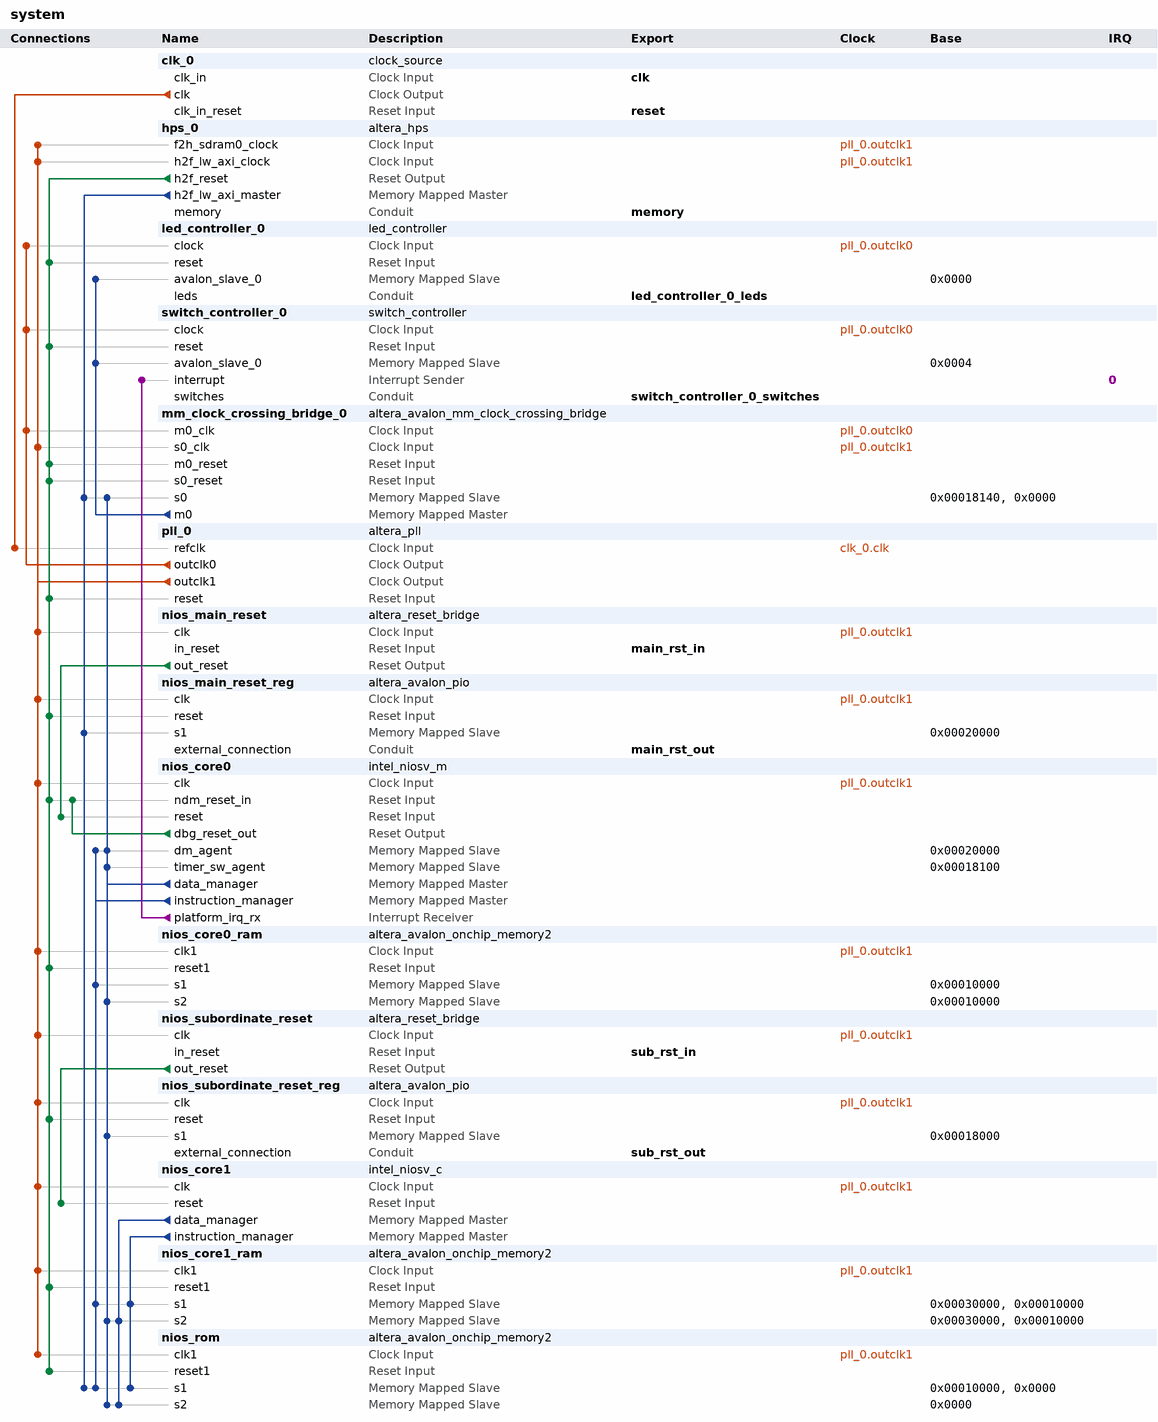
[diagram p0: system contents]
# Platform Designer (Qsys) system system, Cyclone V 5CSXFC6D6F31C6
# Parameters at their usual value, and those the tool derives, are not listed.
package require -exact qsys 25.1
create_system system
set_project_property DEVICE_FAMILY {Cyclone V}
set_project_property DEVICE 5CSXFC6D6F31C6

add_instance clk_0 clock_source 25.1
set_instance_parameter_value clk_0 clockFrequency 50000000
set_instance_parameter_value clk_0 resetSynchronousEdges DEASSERT

add_instance hps_0 altera_hps 25.1
set_instance_parameter_value hps_0 EMAC1_Mode N/A
set_instance_parameter_value hps_0 EMAC1_PinMuxing Unused
set_instance_parameter_value hps_0 F2SCLK_COLDRST_Enable false
set_instance_parameter_value hps_0 F2SCLK_DBGRST_Enable false
set_instance_parameter_value hps_0 F2SCLK_WARMRST_Enable false
set_instance_parameter_value hps_0 F2SDRAM_Type AXI-3
set_instance_parameter_value hps_0 F2SDRAM_Width 32
set_instance_parameter_value hps_0 F2SINTERRUPT_Enable false
set_instance_parameter_value hps_0 F2S_Width 0
set_instance_parameter_value hps_0 FPGA_PERIPHERAL_OUTPUT_CLOCK_FREQ_EMAC0_GTX_CLK 125
set_instance_parameter_value hps_0 FPGA_PERIPHERAL_OUTPUT_CLOCK_FREQ_EMAC0_MD_CLK 2.5
set_instance_parameter_value hps_0 FPGA_PERIPHERAL_OUTPUT_CLOCK_FREQ_EMAC1_GTX_CLK 125
set_instance_parameter_value hps_0 FPGA_PERIPHERAL_OUTPUT_CLOCK_FREQ_EMAC1_MD_CLK 2.5
set_instance_parameter_value hps_0 HPS_PROTOCOL DDR3
set_instance_parameter_value hps_0 I2C0_Mode N/A
set_instance_parameter_value hps_0 I2C0_PinMuxing Unused
set_instance_parameter_value hps_0 I2C1_Mode N/A
set_instance_parameter_value hps_0 I2C1_PinMuxing Unused
set_instance_parameter_value hps_0 LWH2F_Enable true
set_instance_parameter_value hps_0 MEM_BANKADDR_WIDTH 3
set_instance_parameter_value hps_0 MEM_CLK_FREQ 300.0
set_instance_parameter_value hps_0 MEM_CLK_FREQ_MAX 400.0
set_instance_parameter_value hps_0 MEM_COL_ADDR_WIDTH 8
set_instance_parameter_value hps_0 MEM_DQ_WIDTH 32
set_instance_parameter_value hps_0 MEM_DRV_STR RZQ/6
set_instance_parameter_value hps_0 MEM_ROW_ADDR_WIDTH 12
set_instance_parameter_value hps_0 MEM_RTT_NOM {ODT Disabled}
set_instance_parameter_value hps_0 MEM_RTT_WR {Dynamic ODT off}
set_instance_parameter_value hps_0 MEM_TCL 7
set_instance_parameter_value hps_0 MEM_TFAW_NS 37.5
set_instance_parameter_value hps_0 MEM_TINIT_US 499
set_instance_parameter_value hps_0 MEM_TMRD_CK 3
set_instance_parameter_value hps_0 MEM_TRAS_NS 40.0
set_instance_parameter_value hps_0 MEM_TRCD_NS 15.0
set_instance_parameter_value hps_0 MEM_TREFI_US 7.0
set_instance_parameter_value hps_0 MEM_TRFC_NS 75.0
set_instance_parameter_value hps_0 MEM_TRP_NS 15.0
set_instance_parameter_value hps_0 MEM_TWTR 2
set_instance_parameter_value hps_0 MEM_VENDOR JEDEC
set_instance_parameter_value hps_0 MEM_WTCL 6
set_instance_parameter_value hps_0 MPU_EVENTS_Enable true
set_instance_parameter_value hps_0 QSPI_Mode N/A
set_instance_parameter_value hps_0 QSPI_PinMuxing Unused
set_instance_parameter_value hps_0 REF_CLK_FREQ 125.0
set_instance_parameter_value hps_0 S2FCLK_USER2CLK 2
set_instance_parameter_value hps_0 S2F_Width 0
set_instance_parameter_value hps_0 SDIO_Mode N/A
set_instance_parameter_value hps_0 SDIO_PinMuxing Unused
set_instance_parameter_value hps_0 SPIM1_Mode N/A
set_instance_parameter_value hps_0 SPIM1_PinMuxing Unused
set_instance_parameter_value hps_0 STM_Enable false
set_instance_parameter_value hps_0 TIMING_BOARD_AC_SKEW 0.02
set_instance_parameter_value hps_0 TIMING_BOARD_AC_TO_CK_SKEW 0.0
set_instance_parameter_value hps_0 TIMING_BOARD_DQ_TO_DQS_SKEW 0.0
set_instance_parameter_value hps_0 TIMING_BOARD_MAX_CK_DELAY 0.6
set_instance_parameter_value hps_0 TIMING_BOARD_MAX_DQS_DELAY 0.6
set_instance_parameter_value hps_0 TIMING_BOARD_SKEW_BETWEEN_DQS 0.02
set_instance_parameter_value hps_0 TIMING_BOARD_SKEW_CKDQS_DIMM_MAX 0.01
set_instance_parameter_value hps_0 TIMING_BOARD_SKEW_CKDQS_DIMM_MIN -0.01
set_instance_parameter_value hps_0 TIMING_BOARD_SKEW_WITHIN_DQS 0.02
set_instance_parameter_value hps_0 TIMING_TDH 125
set_instance_parameter_value hps_0 TIMING_TDQSCK 400
set_instance_parameter_value hps_0 TIMING_TDQSQ 120
set_instance_parameter_value hps_0 TIMING_TDS 50
set_instance_parameter_value hps_0 TIMING_TIH 250
set_instance_parameter_value hps_0 TIMING_TIS 175
set_instance_parameter_value hps_0 TIMING_TQSH 0.38
set_instance_parameter_value hps_0 UART0_Mode N/A
set_instance_parameter_value hps_0 UART0_PinMuxing Unused
set_instance_parameter_value hps_0 USB1_Mode N/A
set_instance_parameter_value hps_0 USB1_PinMuxing Unused
set_instance_parameter_value hps_0 desired_cfg_clk_mhz 100.0
set_instance_parameter_value hps_0 desired_qspi_clk_mhz 400.0

add_instance led_controller_0 led_controller 1.0

add_instance switch_controller_0 switch_controller 1.0

add_instance mm_clock_crossing_bridge_0 altera_avalon_mm_clock_crossing_bridge 25.1
set_instance_parameter_value mm_clock_crossing_bridge_0 ADDRESS_WIDTH 2
set_instance_parameter_value mm_clock_crossing_bridge_0 COMMAND_FIFO_DEPTH 4
set_instance_parameter_value mm_clock_crossing_bridge_0 DATA_WIDTH 32
set_instance_parameter_value mm_clock_crossing_bridge_0 MASTER_SYNC_DEPTH 2
set_instance_parameter_value mm_clock_crossing_bridge_0 MAX_BURST_SIZE 1
set_instance_parameter_value mm_clock_crossing_bridge_0 RESPONSE_FIFO_DEPTH 4
set_instance_parameter_value mm_clock_crossing_bridge_0 SLAVE_SYNC_DEPTH 2
set_instance_parameter_value mm_clock_crossing_bridge_0 USE_AUTO_ADDRESS_WIDTH 1

add_instance pll_0 altera_pll 25.1
set_instance_parameter_value pll_0 gui_actual_output_clock_frequency0 {548.275862 MHz}
set_instance_parameter_value pll_0 gui_device_speed_grade 1
set_instance_parameter_value pll_0 gui_number_of_clocks 2
set_instance_parameter_value pll_0 gui_operation_mode direct
set_instance_parameter_value pll_0 gui_output_clock_frequency0 300.0
set_instance_parameter_value pll_0 gui_output_clock_frequency1 125.0
set_instance_parameter_value pll_0 gui_pll_mode {Integer-N PLL}
set_instance_parameter_value pll_0 gui_reference_clock_frequency 50.0
set_instance_parameter_value pll_0 gui_use_locked true

add_instance nios_main_reset altera_reset_bridge 25.1
set_instance_parameter_value nios_main_reset ACTIVE_LOW_RESET 0
set_instance_parameter_value nios_main_reset SYNCHRONOUS_EDGES deassert

add_instance nios_main_reset_reg altera_avalon_pio 25.1
set_instance_parameter_value nios_main_reset_reg direction InOut
set_instance_parameter_value nios_main_reset_reg resetValue 1
set_instance_parameter_value nios_main_reset_reg width 32

add_instance nios_core0 intel_niosv_m 26.0.0
set_instance_parameter_value nios_core0 clockFrequency 125000000
set_instance_parameter_value nios_core0 enableAvalonInterface true
set_instance_parameter_value nios_core0 enableDebugReset true
set_instance_parameter_value nios_core0 enableECCFull false
set_instance_parameter_value nios_core0 enableECCLite false
set_instance_parameter_value nios_core0 hartId 0
set_instance_parameter_value nios_core0 interruptMode 1
set_instance_parameter_value nios_core0 pipelineArch true
set_instance_parameter_value nios_core0 resetSlave nios_rom.s1

add_instance nios_core0_ram altera_avalon_onchip_memory2 25.1
set_instance_parameter_value nios_core0_ram dataWidth 128
set_instance_parameter_value nios_core0_ram dualPort true
set_instance_parameter_value nios_core0_ram initMemContent false
set_instance_parameter_value nios_core0_ram initializationFileName onchip_mem.hex
set_instance_parameter_value nios_core0_ram memorySize 32768
set_instance_parameter_value nios_core0_ram readDuringWriteMode OLD_DATA
set_instance_parameter_value nios_core0_ram singleClockOperation true

add_instance nios_subordinate_reset altera_reset_bridge 25.1
set_instance_parameter_value nios_subordinate_reset ACTIVE_LOW_RESET 0
set_instance_parameter_value nios_subordinate_reset SYNCHRONOUS_EDGES deassert

add_instance nios_subordinate_reset_reg altera_avalon_pio 25.1
set_instance_parameter_value nios_subordinate_reset_reg captureEdge true
set_instance_parameter_value nios_subordinate_reset_reg direction InOut
set_instance_parameter_value nios_subordinate_reset_reg resetValue 1
set_instance_parameter_value nios_subordinate_reset_reg width 32

add_instance nios_core1 intel_niosv_c 4.1.0
set_instance_parameter_value nios_core1 archSize 32
set_instance_parameter_value nios_core1 clockFrequency 125000000
set_instance_parameter_value nios_core1 enableAvalonInterface true
set_instance_parameter_value nios_core1 enableECCLite false
set_instance_parameter_value nios_core1 enableResetReq false
set_instance_parameter_value nios_core1 hartID 1
set_instance_parameter_value nios_core1 numGpr 32
set_instance_parameter_value nios_core1 resetOffset 32768
set_instance_parameter_value nios_core1 resetSlave nios_rom.s1
set_instance_parameter_value nios_core1 useResetReq false

add_instance nios_core1_ram altera_avalon_onchip_memory2 25.1
set_instance_parameter_value nios_core1_ram dataWidth 128
set_instance_parameter_value nios_core1_ram dualPort true
set_instance_parameter_value nios_core1_ram initMemContent false
set_instance_parameter_value nios_core1_ram initializationFileName onchip_mem.hex
set_instance_parameter_value nios_core1_ram memorySize 32768
set_instance_parameter_value nios_core1_ram readDuringWriteMode OLD_DATA
set_instance_parameter_value nios_core1_ram singleClockOperation true

add_instance nios_rom altera_avalon_onchip_memory2 25.1
set_instance_parameter_value nios_rom dataWidth 128
set_instance_parameter_value nios_rom dualPort true
set_instance_parameter_value nios_rom initMemContent false
set_instance_parameter_value nios_rom initializationFileName /home/radon/Code/niosv-test/fpga/firmware.hex
set_instance_parameter_value nios_rom memorySize 65536
set_instance_parameter_value nios_rom singleClockOperation true

# connections
add_connection clk_0.clk pll_0.refclk clock
add_connection pll_0.outclk0 led_controller_0.clock clock
add_connection pll_0.outclk0 mm_clock_crossing_bridge_0.m0_clk clock
add_connection pll_0.outclk0 switch_controller_0.clock clock
add_connection pll_0.outclk1 hps_0.f2h_sdram0_clock clock
add_connection pll_0.outclk1 hps_0.h2f_lw_axi_clock clock
add_connection pll_0.outclk1 mm_clock_crossing_bridge_0.s0_clk clock
add_connection pll_0.outclk1 nios_core0.clk clock
add_connection pll_0.outclk1 nios_core0_ram.clk1 clock
add_connection pll_0.outclk1 nios_core1.clk clock
add_connection pll_0.outclk1 nios_core1_ram.clk1 clock
add_connection pll_0.outclk1 nios_main_reset.clk clock
add_connection pll_0.outclk1 nios_main_reset_reg.clk clock
add_connection pll_0.outclk1 nios_rom.clk1 clock
add_connection pll_0.outclk1 nios_subordinate_reset.clk clock
add_connection pll_0.outclk1 nios_subordinate_reset_reg.clk clock
add_connection hps_0.h2f_reset led_controller_0.reset reset
add_connection hps_0.h2f_reset mm_clock_crossing_bridge_0.m0_reset reset
add_connection hps_0.h2f_reset mm_clock_crossing_bridge_0.s0_reset reset
add_connection hps_0.h2f_reset nios_core0.ndm_reset_in reset
add_connection hps_0.h2f_reset nios_core0_ram.reset1 reset
add_connection hps_0.h2f_reset nios_core1_ram.reset1 reset
add_connection hps_0.h2f_reset nios_main_reset_reg.reset reset
add_connection hps_0.h2f_reset nios_rom.reset1 reset
add_connection hps_0.h2f_reset nios_subordinate_reset_reg.reset reset
add_connection hps_0.h2f_reset pll_0.reset reset
add_connection hps_0.h2f_reset switch_controller_0.reset reset
add_connection nios_core0.dbg_reset_out nios_core0.ndm_reset_in reset
add_connection nios_main_reset.out_reset nios_core0.reset reset
add_connection nios_subordinate_reset.out_reset nios_core1.reset reset
add_connection hps_0.h2f_lw_axi_master mm_clock_crossing_bridge_0.s0 avalon
set_connection_parameter_value hps_0.h2f_lw_axi_master/mm_clock_crossing_bridge_0.s0 baseAddress 0x0000
add_connection hps_0.h2f_lw_axi_master nios_main_reset_reg.s1 avalon
set_connection_parameter_value hps_0.h2f_lw_axi_master/nios_main_reset_reg.s1 baseAddress 0x00020000
add_connection hps_0.h2f_lw_axi_master nios_rom.s1 avalon
set_connection_parameter_value hps_0.h2f_lw_axi_master/nios_rom.s1 baseAddress 0x00010000
add_connection mm_clock_crossing_bridge_0.m0 led_controller_0.avalon_slave_0 avalon
set_connection_parameter_value mm_clock_crossing_bridge_0.m0/led_controller_0.avalon_slave_0 baseAddress 0x0000
add_connection mm_clock_crossing_bridge_0.m0 switch_controller_0.avalon_slave_0 avalon
set_connection_parameter_value mm_clock_crossing_bridge_0.m0/switch_controller_0.avalon_slave_0 baseAddress 0x0004
add_connection nios_core0.data_manager mm_clock_crossing_bridge_0.s0 avalon
set_connection_parameter_value nios_core0.data_manager/mm_clock_crossing_bridge_0.s0 baseAddress 0x00018140
add_connection nios_core0.data_manager nios_core0.dm_agent avalon
set_connection_parameter_value nios_core0.data_manager/nios_core0.dm_agent baseAddress 0x00020000
add_connection nios_core0.data_manager nios_core0.timer_sw_agent avalon
set_connection_parameter_value nios_core0.data_manager/nios_core0.timer_sw_agent baseAddress 0x00018100
add_connection nios_core0.data_manager nios_core0_ram.s2 avalon
set_connection_parameter_value nios_core0.data_manager/nios_core0_ram.s2 baseAddress 0x00010000
add_connection nios_core0.data_manager nios_core1_ram.s2 avalon
set_connection_parameter_value nios_core0.data_manager/nios_core1_ram.s2 baseAddress 0x00030000
add_connection nios_core0.data_manager nios_rom.s2 avalon
set_connection_parameter_value nios_core0.data_manager/nios_rom.s2 baseAddress 0x0000
add_connection nios_core0.data_manager nios_subordinate_reset_reg.s1 avalon
set_connection_parameter_value nios_core0.data_manager/nios_subordinate_reset_reg.s1 baseAddress 0x00018000
add_connection nios_core0.instruction_manager nios_core0.dm_agent avalon
set_connection_parameter_value nios_core0.instruction_manager/nios_core0.dm_agent baseAddress 0x00020000
add_connection nios_core0.instruction_manager nios_core0_ram.s1 avalon
set_connection_parameter_value nios_core0.instruction_manager/nios_core0_ram.s1 baseAddress 0x00010000
add_connection nios_core0.instruction_manager nios_core1_ram.s1 avalon
set_connection_parameter_value nios_core0.instruction_manager/nios_core1_ram.s1 baseAddress 0x00030000
add_connection nios_core0.instruction_manager nios_rom.s1 avalon
set_connection_parameter_value nios_core0.instruction_manager/nios_rom.s1 baseAddress 0x0000
add_connection nios_core1.data_manager nios_core1_ram.s2 avalon
set_connection_parameter_value nios_core1.data_manager/nios_core1_ram.s2 baseAddress 0x00010000
add_connection nios_core1.data_manager nios_rom.s2 avalon
set_connection_parameter_value nios_core1.data_manager/nios_rom.s2 baseAddress 0x0000
add_connection nios_core1.instruction_manager nios_core1_ram.s1 avalon
set_connection_parameter_value nios_core1.instruction_manager/nios_core1_ram.s1 baseAddress 0x00010000
add_connection nios_core1.instruction_manager nios_rom.s1 avalon
set_connection_parameter_value nios_core1.instruction_manager/nios_rom.s1 baseAddress 0x0000
add_connection nios_core0.platform_irq_rx switch_controller_0.interrupt interrupt
set_connection_parameter_value nios_core0.platform_irq_rx/switch_controller_0.interrupt irqNumber 0

# exported interfaces
add_interface clk clock sink
set_interface_property clk EXPORT_OF clk_0.clk_in
add_interface led_controller_0_leds conduit end
set_interface_property led_controller_0_leds EXPORT_OF led_controller_0.leds
add_interface main_rst_in reset sink
set_interface_property main_rst_in EXPORT_OF nios_main_reset.in_reset
add_interface main_rst_out conduit end
set_interface_property main_rst_out EXPORT_OF nios_main_reset_reg.external_connection
add_interface memory conduit end
set_interface_property memory EXPORT_OF hps_0.memory
add_interface reset reset sink
set_interface_property reset EXPORT_OF clk_0.clk_in_reset
add_interface sub_rst_in reset sink
set_interface_property sub_rst_in EXPORT_OF nios_subordinate_reset.in_reset
add_interface sub_rst_out conduit end
set_interface_property sub_rst_out EXPORT_OF nios_subordinate_reset_reg.external_connection
add_interface switch_controller_0_switches conduit end
set_interface_property switch_controller_0_switches EXPORT_OF switch_controller_0.switches

set_interconnect_requirement {$system} qsys_mm.clockCrossingAdapter HANDSHAKE
set_interconnect_requirement {$system} qsys_mm.enableEccProtection FALSE
set_interconnect_requirement {$system} qsys_mm.insertDefaultSlave FALSE
set_interconnect_requirement {$system} qsys_mm.maxAdditionalLatency 4

save_system system.qsys
